# Altium schematic sheet VOLTAGE_MEASURE.SchDoc
size A2; SheetNumber: 8; SheetTotal: 9
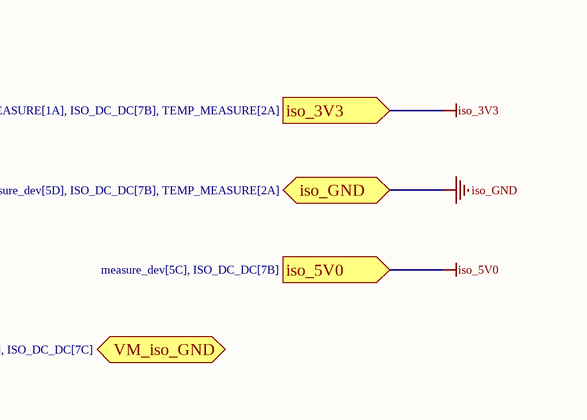
[diagram p0: VOLTAGE_MEASURE.SchDoc, top left]
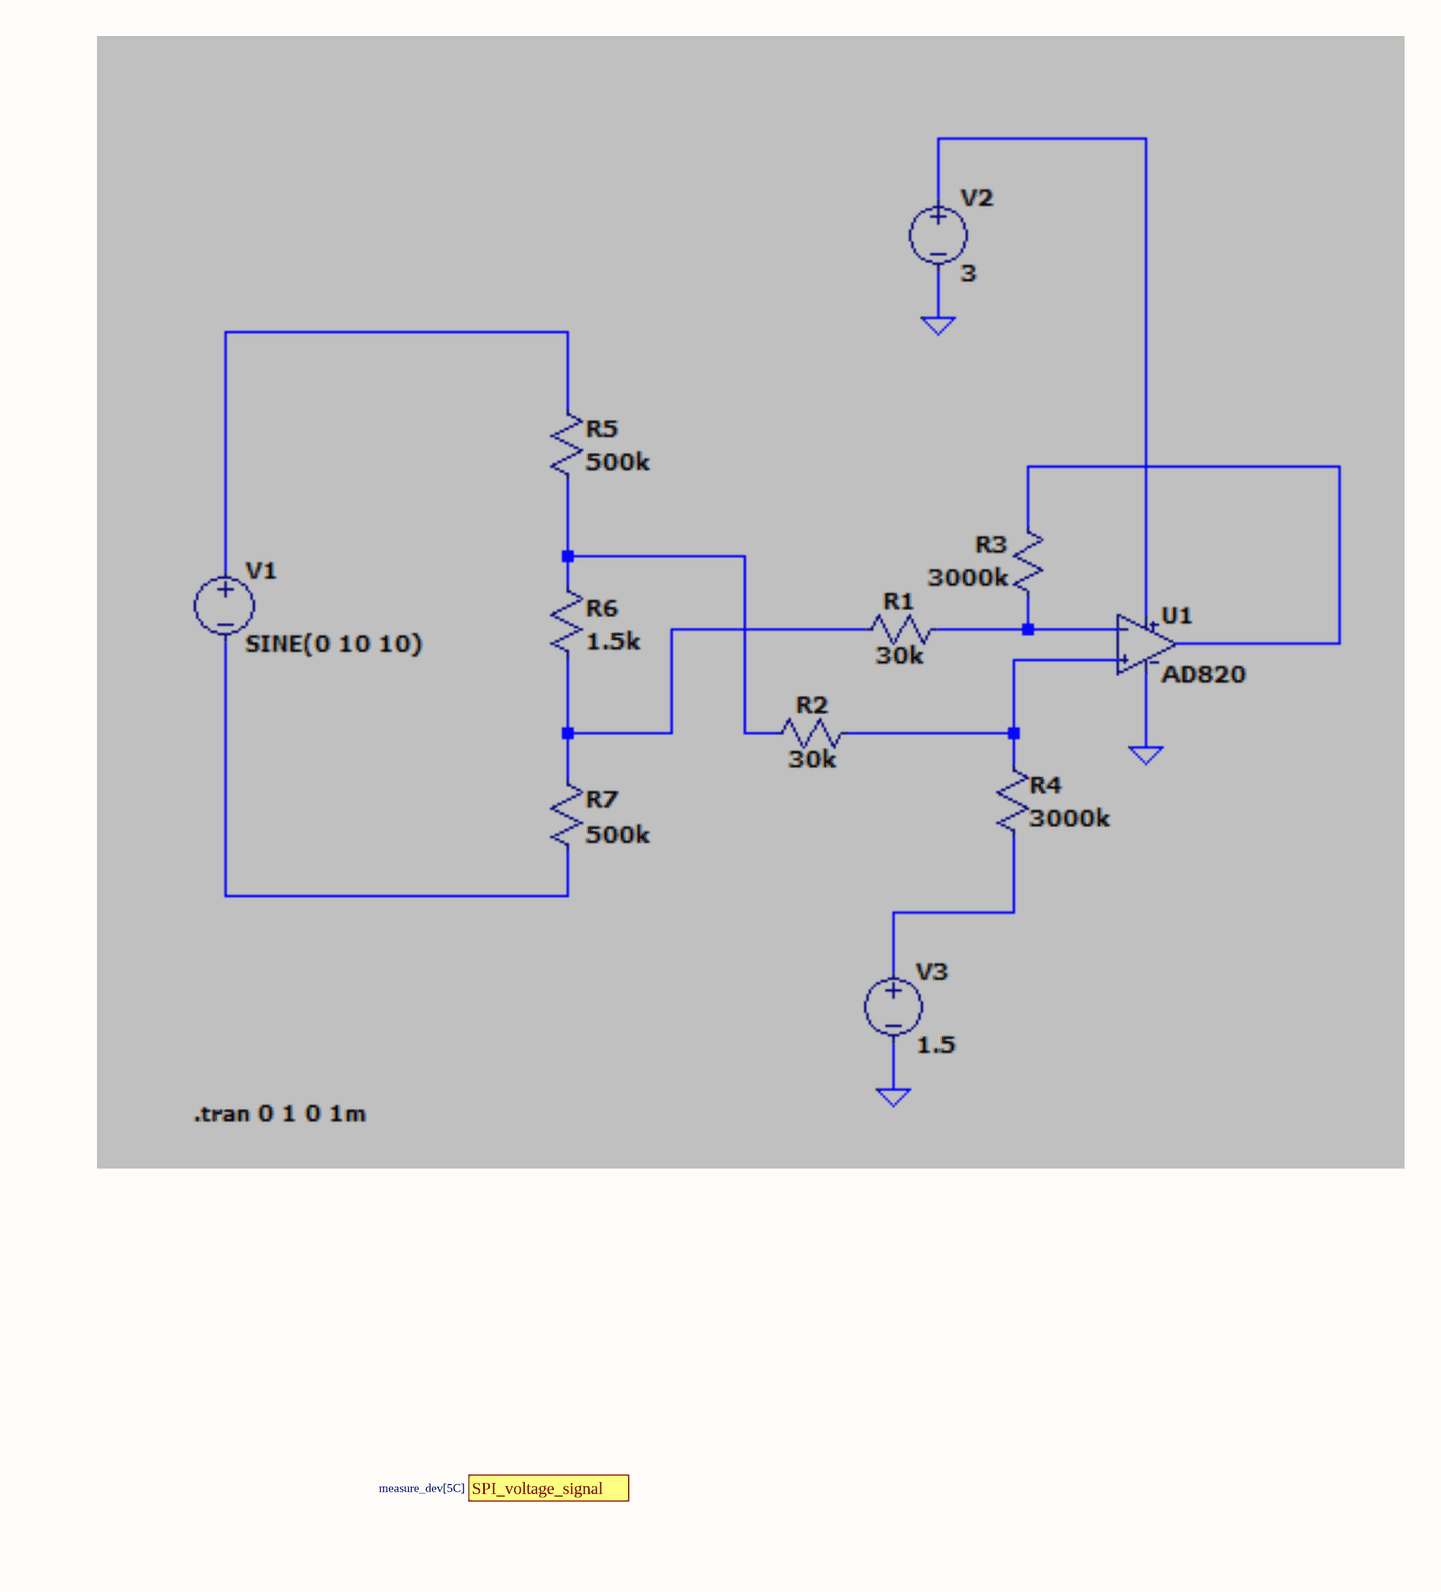
[diagram p1: VOLTAGE_MEASURE.SchDoc, top right]
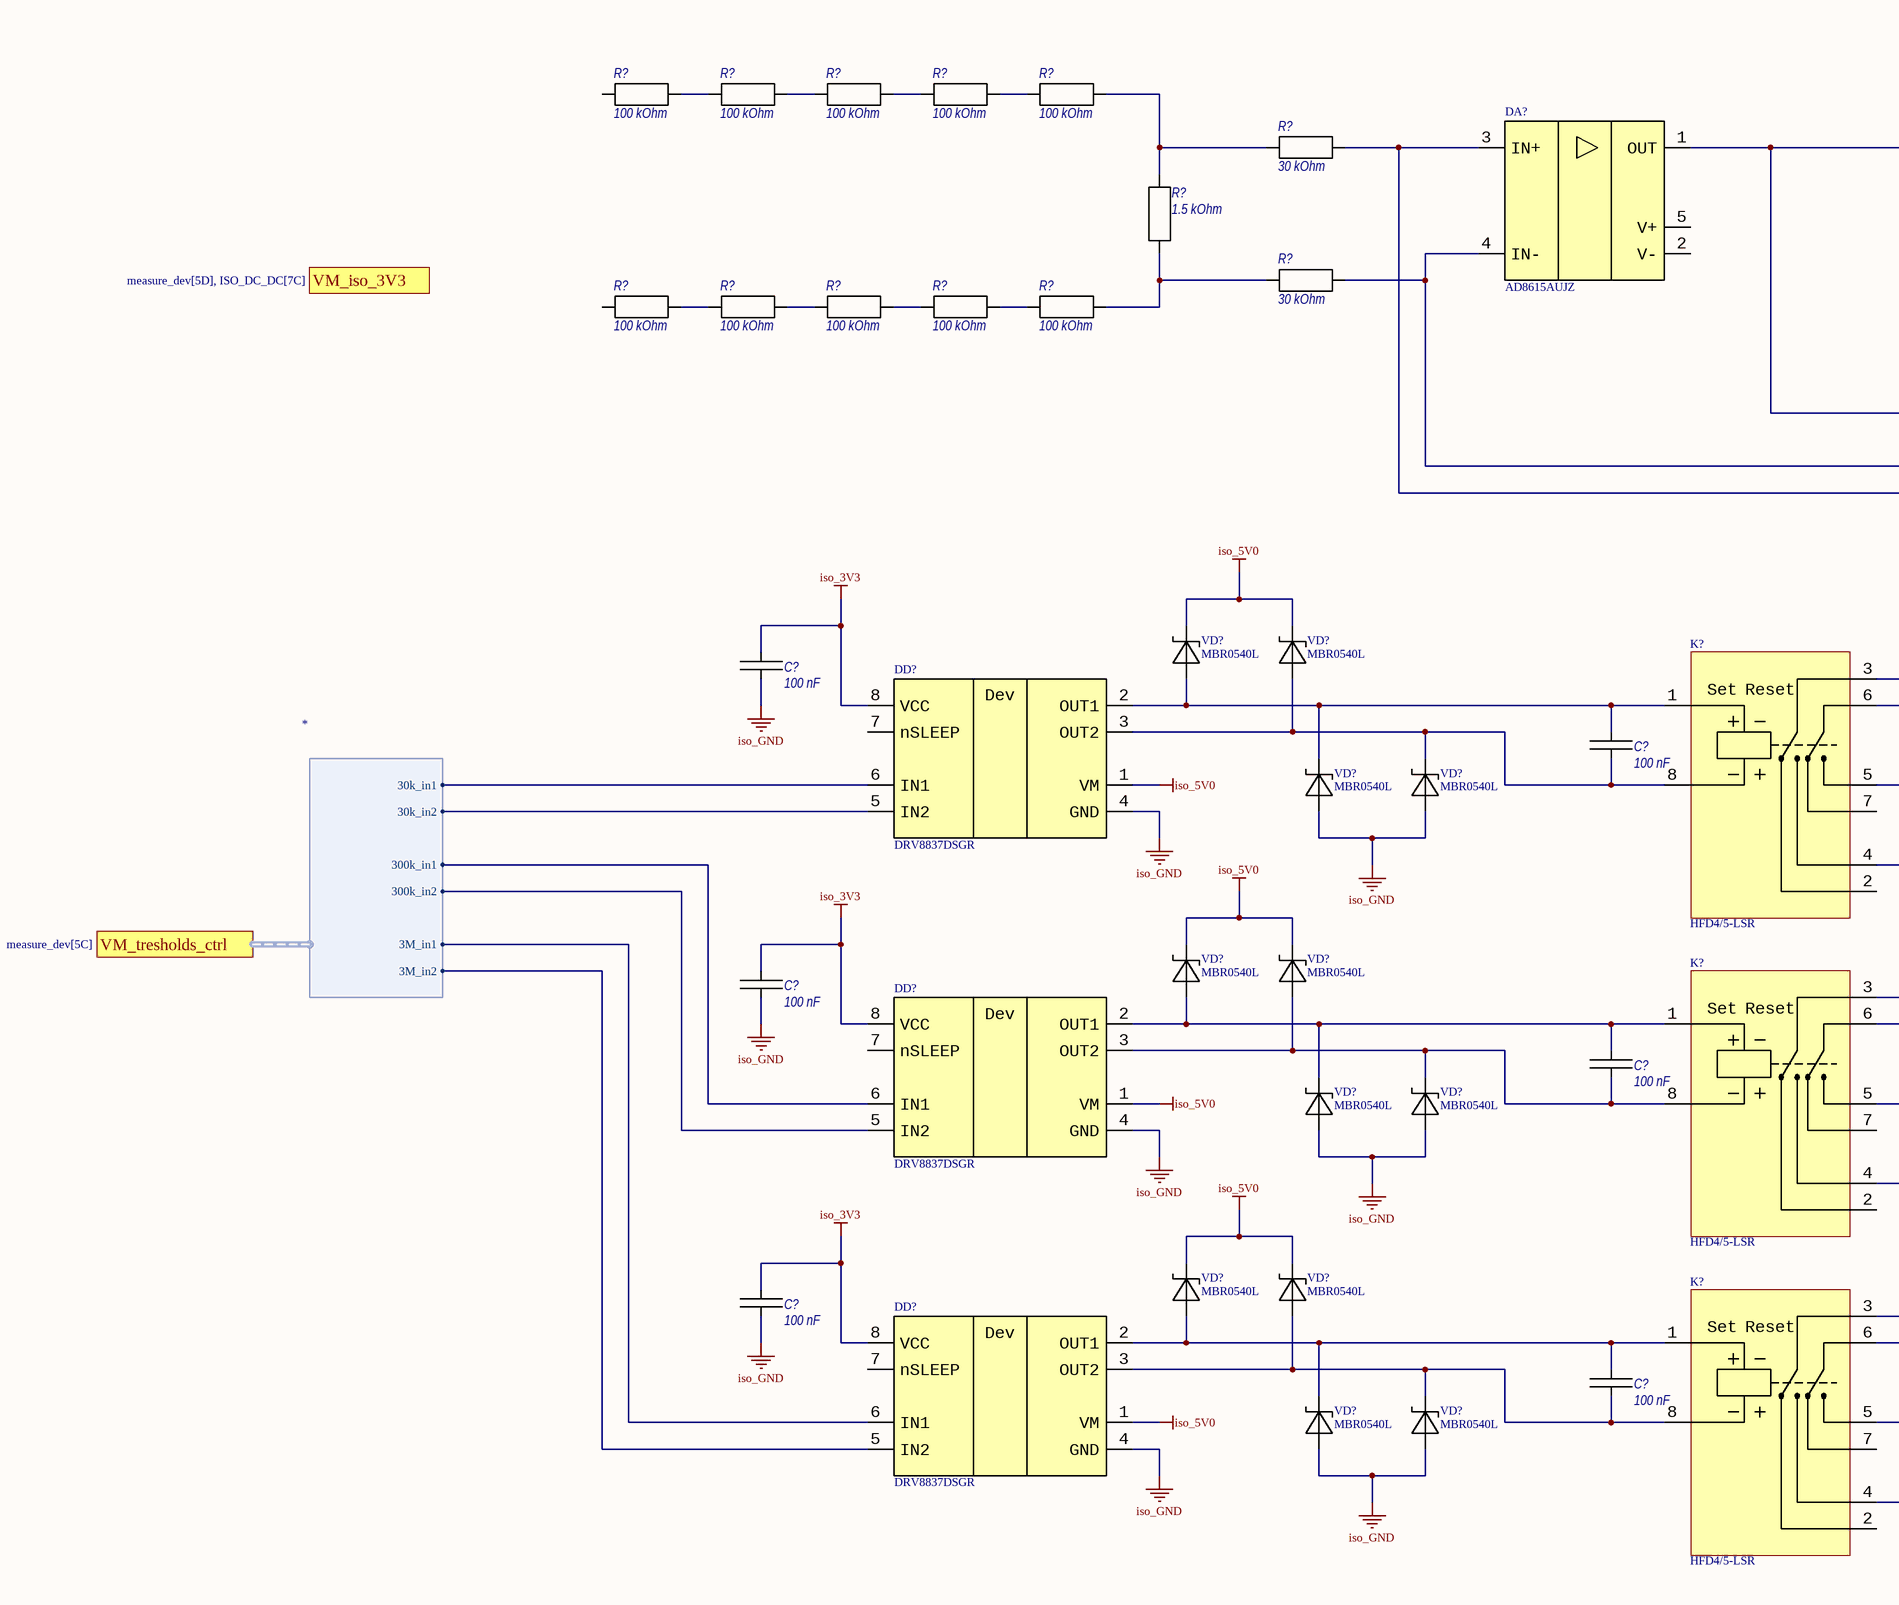
[diagram p2: VOLTAGE_MEASURE.SchDoc, bottom left]
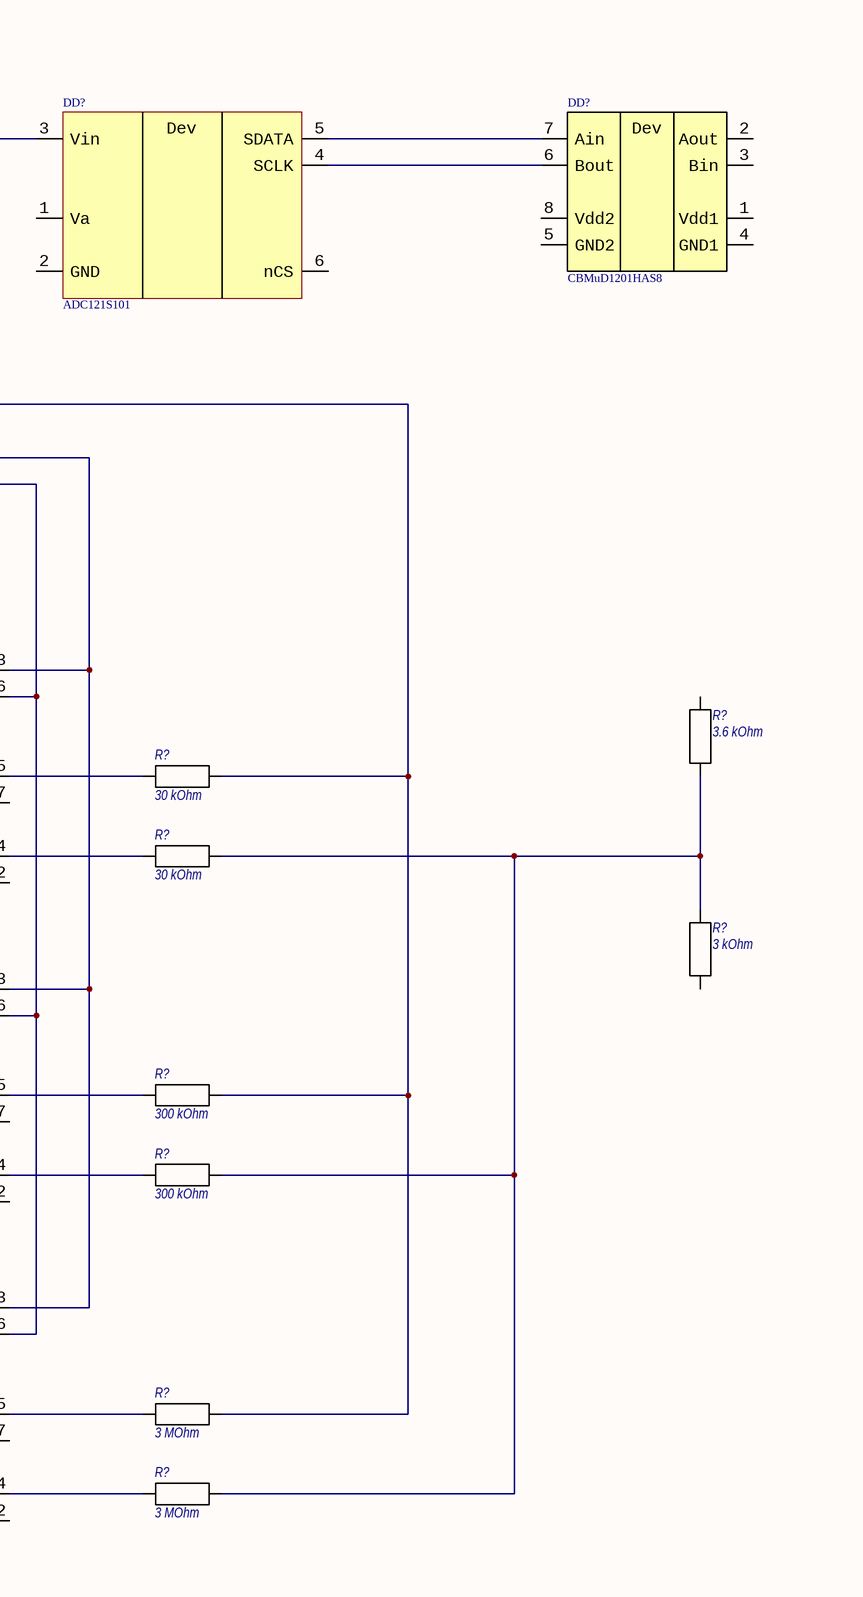
[diagram p3: VOLTAGE_MEASURE.SchDoc, bottom right]

## Parts
(Parts that share a designator on the sheet are numbered #1, #2 ... from top to bottom, then left to right.)
C?#1  100 nF  [0603C]
C?#2  100 nF  [0603C]
C?#3  100 nF  [0603C]
C?#4  100 nF  [0603C]
C?#5  100 nF  [0603C]
C?#6  100 nF  [0603C]
DA?  AD8615AUJZ  [SOT-23-5]
DD?#1  ADC121S101  [SOT-23-6]
DD?#2  CBMuD1201HAS8  [SO-8]
DD?#3  DRV8837DSGR  [WSON-8P-2X2]
DD?#4  DRV8837DSGR  [WSON-8P-2X2]
DD?#5  DRV8837DSGR  [WSON-8P-2X2]
K?#1  HFD4/5-LSR  [Relay_10_6.2_5.4]
K?#2  HFD4/5-LSR  [Relay_10_6.2_5.4]
K?#3  HFD4/5-LSR  [Relay_10_6.2_5.4]
R?#1  100 kOhm  [0805R]
R?#2  100 kOhm  [0805R]
R?#3  100 kOhm  [0805R]
R?#4  100 kOhm  [0805R]
R?#5  100 kOhm  [0805R]
R?#6  30 kOhm  [0603R]
R?#7  1.5 kOhm  [0603R]
R?#8  30 kOhm  [0603R]
R?#9  100 kOhm  [0805R]
R?#10  100 kOhm  [0805R]
R?#11  100 kOhm  [0805R]
R?#12  100 kOhm  [0805R]
R?#13  100 kOhm  [0805R]
R?#14  3.6 kOhm  [0603R]
R?#15  30 kOhm  [0603R]
R?#16  30 kOhm  [0603R]
R?#17  3 kOhm  [0603R]
R?#18  300 kOhm  [0603R]
R?#19  300 kOhm  [0603R]
R?#20  3 MOhm  [0603R]
R?#21  3 MOhm  [0603R]
VD?#1  MBR0540L  [SOD-123]
VD?#2  MBR0540L  [SOD-123]
VD?#3  MBR0540L  [SOD-123]
VD?#4  MBR0540L  [SOD-123]
VD?#5  MBR0540L  [SOD-123]
VD?#6  MBR0540L  [SOD-123]
VD?#7  MBR0540L  [SOD-123]
VD?#8  MBR0540L  [SOD-123]
VD?#9  MBR0540L  [SOD-123]
VD?#10  MBR0540L  [SOD-123]
VD?#11  MBR0540L  [SOD-123]
VD?#12  MBR0540L  [SOD-123]

## Ports
iso_3V3 (in, see measure_dev[5D], CURRENT_MEASURE[1A], ISO_DC_DC[7B], TEMP_MEASURE[2A]), iso_5V0 (in, see measure_dev[5C], ISO_DC_DC[7B]), iso_GND (bidir, see measure_dev[5D], ISO_DC_DC[7B], TEMP_MEASURE[2A]), SPI_voltage_signal (see measure_dev[5C]), VM_iso_3V3 (in, see measure_dev[5D], ISO_DC_DC[7C]), VM_iso_GND (bidir, see measure_dev[5D], ISO_DC_DC[7C]), VM_tresholds_ctrl (harness *, see measure_dev[5C])

## Harnesses
*: 30k_in1, 30k_in2, 300k_in1, 300k_in2, 3M_in1, 3M_in2

## Nets
iso_3V3: C?#1.1 C?#3.1 C?#5.1 DD?#3.8(VCC) DD?#4.8(VCC) DD?#5.8(VCC) ; port iso_3V3
iso_5V0: DD?#3.1(VM) DD?#4.1(VM) DD?#5.1(VM) VD?#1.C VD?#2.C VD?#5.C VD?#6.C VD?#9.C VD?#10.C ; port iso_5V0
iso_GND: C?#1.2 C?#3.2 C?#5.2 DD?#3.4(GND) DD?#4.4(GND) DD?#5.4(GND) VD?#3.A VD?#4.A VD?#7.A VD?#8.A VD?#11.A VD?#12.A ; port iso_GND
NetC?#2_1: C?#2.1 DD?#3.2(OUT1) K?#1.1 VD?#1.A VD?#3.C
NetC?#2_2: C?#2.2 DD?#3.3(OUT2) K?#1.8 VD?#2.A VD?#4.C
NetC?#4_1: C?#4.1 DD?#4.2(OUT1) K?#2.1 VD?#5.A VD?#7.C
NetC?#4_2: C?#4.2 DD?#4.3(OUT2) K?#2.8 VD?#6.A VD?#8.C
NetC?#6_1: C?#6.1 DD?#5.2(OUT1) K?#3.1 VD?#9.A VD?#11.C
NetC?#6_2: C?#6.2 DD?#5.3(OUT2) K?#3.8 VD?#10.A VD?#12.C
NetDA?_1: DA?.1(OUT) DD?#1.3(Vin) R?#15.1 R?#18.1 R?#20.1
NetDA?_3: DA?.3(IN+) K?#1.6 K?#2.6 K?#3.6 R?#6.1
NetDA?_4: DA?.4(IN-) K?#1.3 K?#2.3 K?#3.3 R?#8.1
NetDD?#1_4: DD?#1.4(SCLK) DD?#2.6(Bout)
NetDD?#1_5: DD?#1.5(SDATA) DD?#2.7(Ain)
NetDD?#3_5: DD?#3.5(IN2) ; port VM_tresholds_ctrl.30k_in2
NetDD?#3_6: DD?#3.6(IN1) ; port VM_tresholds_ctrl.30k_in1
NetDD?#4_5: DD?#4.5(IN2) ; port VM_tresholds_ctrl.300k_in2
NetDD?#4_6: DD?#4.6(IN1) ; port VM_tresholds_ctrl.300k_in1
NetDD?#5_5: DD?#5.5(IN2) ; port VM_tresholds_ctrl.3M_in2
NetDD?#5_6: DD?#5.6(IN1) ; port VM_tresholds_ctrl.3M_in1
NetK?#1_4: K?#1.4 R?#16.2
NetK?#1_5: K?#1.5 R?#15.2
NetK?#2_4: K?#2.4 R?#19.2
NetK?#2_5: K?#2.5 R?#18.2
NetK?#3_4: K?#3.4 R?#21.2
NetK?#3_5: K?#3.5 R?#20.2
NetR?#1_1: R?#1.1 R?#2.2
NetR?#2_1: R?#2.1 R?#3.2
NetR?#3_1: R?#3.1 R?#4.2
NetR?#4_1: R?#4.1 R?#5.2
NetR?#5_1: R?#5.1 R?#6.2 R?#7.1
NetR?#7_2: R?#7.2 R?#8.2 R?#13.1
NetR?#9_1: R?#9.1 R?#10.2
NetR?#10_1: R?#10.1 R?#11.2
NetR?#11_1: R?#11.1 R?#12.2
NetR?#12_1: R?#12.1 R?#13.2
NetR?#14_2: R?#14.2 R?#16.1 R?#17.1 R?#19.1 R?#21.1

Not connected (* = marked no-connect by the designer): DA? 2(V-) 5(V+); DD?#1 1(Va) 2(GND) 6(nCS); DD?#2 1(Vdd1) 2(Aout) 3(Bin) 4(GND1) 5(GND2) 8(Vdd2); DD?#3 7(nSLEEP); DD?#4 7(nSLEEP); DD?#5 7(nSLEEP); K?#1 2 7; K?#2 2 7; K?#3 2 7; R?#1 2; R?#9 2; R?#14 1; R?#17 2

## Notes on the sheet
- (in symbol ADC121S101) Dev
- (in symbol CBMuD1201HAS8) Dev
- (in symbol DRV8837DSGR) Dev
- (in symbol HFD4/5-LSR) Set; Reset

## Library data of the parts
C?#1-C?#6 = CL10B104KB8NNN: Manufacturer: Samsung; Tolerance: 10%; Voltage: 50 V; Dielectric: X7R; Part Number: CL10B104KB8NNN; Package: 0603; Value: 100 nF
DA? = AD8615AUJZ: Manufacturer: AD; Number of Channels: 1; Supply Voltage: 2.7 - 5 V; Supply Current: 2.5 mA; Iout: 150 mA; Ib: 0.2 - 1 pA; Ios: 0.1 — 0.5 pA; Uos: 0.1 mV; Fin: 20 Mhz; Part Number: AD8615AUJZ; Package: SOT-23-5; Type: rail-to-rail, low-power, precizion; Datasheet: https://www.elitan.ru/pdf/0//7//0//8//5//07085661.pdf
DD?#1 = ADC121S101: 1 chanel ADC, 12 bit, SPI, 1 MSPS; Manufacturer: TI; Part Number: ADC121S101; Package: SOT-23-6; Datasheet: https://www.elitan.ru/pdf/0//3//7//8//7//03787719.pdf
DD?#2 = CBMuD1201HAS8: Manufacturer: COREBAI; Number of Channels: 2; Part Number: CBMuD1201HAS8; Package: SO-8; Input Current: -; Input Reverse Voltage: -; Output Current: -; Output Power: -; Type: digital isolator 2 directions 2 ways; Datasheet: https://static.chipdip.ru/lib/815/DOC059815915.pdf
DD?#3-DD?#5 = DRV8837DSGR: -; Manufacturer: TI; Part Number: DRV8837DSGR; Package: WSON-8P-2X2; Type: bridge; Datasheet: https://static.chipdip.ru/lib/788/DOC021788244.pdf
K?#1-K?#3 = HFD4/5-LSR: Manufacturer: Hongfa; Coil Voltage: 5 V; Coil Current/Resistance: 250 Ohm; Max Switching Voltage: 220VDC/250VAC; Max Switching Current: 2 A at 30 VDC, 0.5 A at 125 VAC; Part Number: HFD4/5-LSR; Package: Relay_10_6.2_5.4; Datasheet: https://static.chipdip.ru/lib/796/DOC059796560.pdf
R?#1-R?#5 R?#9-R?#13 = RC0805FR-07100KL: Manufacturer: Yageo; Tolerance: 1%; Power: 0.125 Watt; Part Number: RC0805FR-07100KL; Package: 0805; Value: 100 kOhm
R?#6 R?#8 R?#15 R?#16 = RC0603FR-0730KL: Manufacturer: Yageo; Tolerance: 1%; Power: 0.100 Watt; Part Number: RC0603FR-0730KL; Package: 0603; Value: 30 kOhm
R?#7 = RC0603FR-071K5L: Manufacturer: Yageo; Tolerance: 1%; Power: 0.100 Watt; Part Number: RC0603FR-071K5L; Package: 0603; Value: 1.5 kOhm
R?#14 = RC0603FR-073K6L: Manufacturer: Yageo; Tolerance: 1%; Power: 0.100 Watt; Part Number: RC0603FR-073K6L; Package: 0603; Value: 3.6 kOhm
R?#17 = RC0603FR-073KL: Manufacturer: Yageo; Tolerance: 1%; Power: 0.100 Watt; Part Number: RC0603FR-073KL; Package: 0603; Value: 3 kOhm
R?#18 R?#19 = RC0603FR-07300KL: Manufacturer: Yageo; Tolerance: 1%; Power: 0.100 Watt; Part Number: RC0603FR-07300KL; Package: 0603; Value: 300 kOhm
R?#20 R?#21 = RC0603FR-073ML: Manufacturer: Yageo; Tolerance: 1%; Power: 0.100 Watt; Part Number: RC0603FR-073ML; Package: 0603; Value: 3 MOhm
VD?#1-VD?#12 = MBR0540L: Manufacturer: HOTTECH; max Current: 500 mA; Reverse Voltage: 40 V; Part Number: MBR0540L; Package: SOD-123; Pppm: -; Datasheet: https://doc.platan.ru/pdf/datasheets/hottech/MBR0520L-0540L.pdf